# Altium schematic sheet 400_DC-DC.SchDoc: DC-DC Convertion stage
size A4; Date: XXXXXX; Author: Y.Gonzalez; Revision: R1V0; SheetNumber: 5; SheetTotal: 5
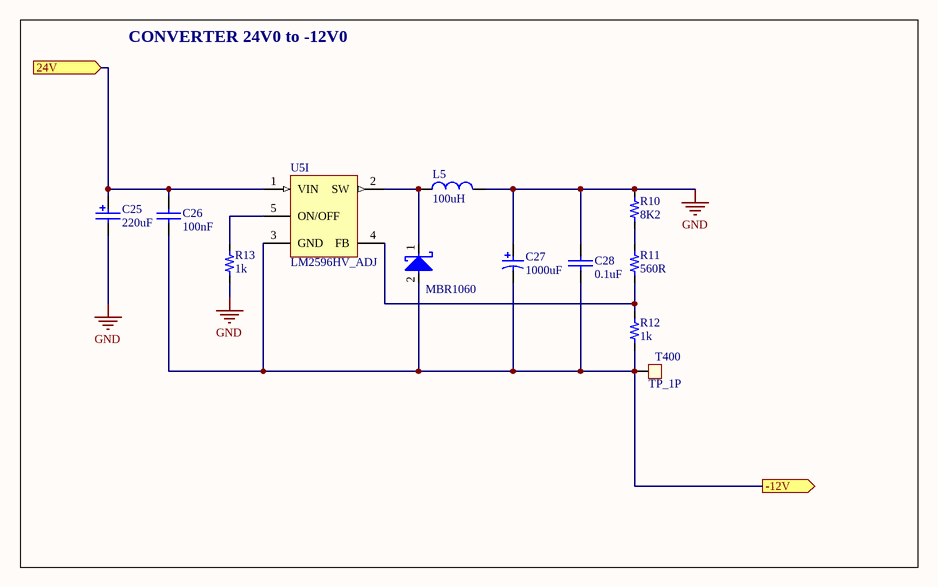
[diagram p0: 400_DC-DC.SchDoc]

## Parts
C25  value 220uF  [RADIAL-CAN-SMD_Diax8mm_Hx10.2mm]  (hidden comment: 220uF 50V)
C26  value 100nF  [1206]  (hidden comment: 100nF 100V)
C27  value 1000uF  [RADIAL-CAN_LSx5mm_Diax10mm_Hx14mm]  (hidden comment: 1000uF 25V)
C28  value 0.1uF  [0402_RF]  (hidden comment: 100nF 25V)
D3  MBR1060  [D_Schottky_60V_10A_TO]
L5  value 100uH  [L_2SMD_8x8.5x5MM_NS]  (hidden comment: 100uH 2.5A)
R10  value 8K2  [0603]  (hidden comment: 1/10W)
R11  value 560R  [0603]  (hidden comment: 560R 1/10W)
R12  value 1k  [0603]  (hidden comment: 1k 1/10W)
R13  value 1k  [0603]  (hidden comment: 1k 1/10W)
T400  TP_1P  [TP_TH_30mil]  (no BOM)
U5  LM2596HV_ADJ  [LM2596HVS-ADJ]  (part I of 9)

## Blocks framed on the sheet
CONVERTER 24V0 to -12V0: C25-C28 D3 L5 R10-R13 T400 U5

## Ports
24V (in), -12V (out)

## Nets
GND: C25.2 C27.1 C28.1 L5.2 R10.2 R13.1
24V: C25.1 C26.1 U5.1(VIN) ; port 24V
-12V: C26.2 C27.2 C28.2 D3.2 R12.1 T400.1 U5.3(GND) ; port -12V
NetD3_1: D3.1 L5.1 U5.2(SW)
NetR10_1: R10.1 R11.2
NetR11_1: R11.1 R12.2 U5.4(FB)
NetR13_2: R13.2 U5.5(ON/OFF)

## Notes on the sheet
- Title:
- Project:
- File:
- Revision:
- Date:
- Size:
- A4
- Drawn by:

## Library data of the parts
C25 = Cap_220uF_50V_ALU_SMD: CAP ALUM 220UF 20% 50V SMD; Manufacturer: Panasonic; Manufacturer Part Number: EEE-FT1H221AP; Supplier 1: Mouser; Supplier Part Number 1: 667-EEE-FT1H221AP; Reel stock: N/A; Last modified by: J.Jaramillo; Last modified date: 20240309; ComponentLink1Description: Mouser; ComponentLink1URL: https://www.mouser.com/ProductDetail/Panasonic/EEE-FT1H221AP?qs=CMJjuEs1%252BuFFGBuxQbDfDA==
C26 = Cap_0.1uF_1206_100V: CAP CER 0.1UF 100V X7R 1206; Manufacturer: Samsung Electro-Mechanics; Manufacturer Part Number: CL31B104KCFNNNE; Supplier 1: Digi-Key; Supplier Part Number 1: 1276-1151-1-ND; Last modified by: J.Jaramillo; Last modified date: 20240309; ComponentLink1Description: Digi-Key; ComponentLink1URL: https://www.digikey.com/en/products/detail/samsung-electro-mechanics/CL31B104KCFNNNE/3886809
C27 = Cap_1000uF_25V_ALU_THT: CAP 1000uf/25V,10*16,105℃ RADIAL; Manufacturer: SamXon; Manufacturer Part Number: KM 1000U/25V; Last modified by: J.Jaramillo; Last modified date: 20240309; Supplier 1: Poshton; Supplier Part Number 1: KM 1000U/25V
C28 = Cap_0.1uF_0402_25V: CAP CER 0.1UF 25V X7R 0402; Manufacturer: Yageo; Manufacturer Part Number: CC0402KRX7R8BB104; Last modified by: J.Jaramillo; Last modified date: 20240309; ComponentLink1Description: Digi-key; ComponentLink1URL: https://www.digikey.com/products/en?keywords=311-2077-1-ND; Supplier 1: Digi-Key; Supplier Part Number 1: 311-2077-1-ND
D3 = D_Schottky_60V_10A_TO: DIODE SCHOTTKY 60V TO-220AC-2; Manufacturer: SMC; Manufacturer Part Number 1: MBR1060; Supplier: LCSC; Supplier Part Number 1: C260256; Last modified date: 25102026; Last modified by: Y.Gonzalez; ComponentLink1Description: LCSC; ComponentLink1URL: https://www.lcsc.com/product-detail/C260256.html?s_z=n_q_x_MBR1060; ComponentLink2Description: Datasheet; ComponentLink2URL: https://www.lcsc.com/datasheet/C260256.pdf; Value: 60V
L5 = L_100uH_2.5A_NS: 2.5A 100uH ±20% 3A SMD,8x8.5mm Power Inductors ROHS; Manufacturer: PROD Tech; Manufacturer Part Number: PSPMAA0805-101M-ANP; Supplier 1: LCSC; Supplier Part Number 1: C2962892; Reel Stock: N/A; Last modified by: J.Jaramillo; Last modified date: 20240310; ComponentLink1Description: Digi-Key; ComponentLink1URL: https://www.digikey.com/en/products/detail/bourns-inc/SRR1280-101M/2127044
R10 = Res_8k2_0603_1/10W: RES SMD 8.2K OHM 1% 1/10W 0603; Manufacturer: Yageo; Manufacturer Part Number: AC0603FR-078K2L; Reel Stock: N/A; Last modified by: J.Jaramillo; Last modified date: 20240310; ComponentLink1Description: Digi-Key; ComponentLink1URL: https://www.digikey.com/en/products/detail/yageo/AC0603FR-078K2L/5896322; Supplier 1: Digi-Key; Supplier Part Number 1: YAG3634CT-ND
R11 = Res_560R_0603_1/10W: RES SMD 560 OHM 1% 1/10W 0603; Manufacturer: Yageo; Manufacturer Part Number: RC0603FR-07560RL; ComponentLink1URL: https://www.digikey.com/product-detail/en/yageo/RC0603FR-07560RL/311-560HRCT-ND/730251; Reel Stock: N/A; Last modified by: J.Jaramillo; Last modified date: 20240310; ComponentLink1Description: Digi-key; Supplier Part Number 1: 311-560HRCT-ND; Supplier 1: Digi-Key
R12 R13 = Res_1k_0603_1/10W: RES SMD 1K OHM 1% 1/10W 0603; Manufacturer: Yageo; Manufacturer Part Number: RC0603FR-071KL; Supplier 1: Digi-Key; Supplier Part Number 1: 311-1.00KHRCT-ND; Reel Stock: N/A; Last modified by: J.Jaramillo; Last modified date: 20240310; ComponentLink1Description: Digi-Key; ComponentLink1URL: https://www.digikey.com/product-detail/en/yageo/RC0603FR-071KL/311-1-00KHRCT-ND/729790
T400 = TP_TH_30mil: Test point 30mil hole size; Last modified by: J.Jaramillo; Last modified date: 20240310
U5 = LDO_12V0_1A_TO263-5: 60V/3A/150kHz Step-Down Switching Regulator; Manufacturer: TECH PUBLIC; Manufacturer Part Number 1: LM2596HVS-ADJ; Supplier Part Number 1: C18221477; Supplier: LCSC; Last modified date: 29102026; Last modified by: Y.Gonzalez; ComponentLink1Description: Datasheet; ComponentLink1URL: https://www.lcsc.com/datasheet/C18221477.pdf; ComponentLink2Description: LCSC; ComponentLink2URL: https://www.lcsc.com/product-detail/C18221477.html?s_z=n_q_lm2596hv